# Altium project MCD_Board.PrjPcb (part 1 of 2)
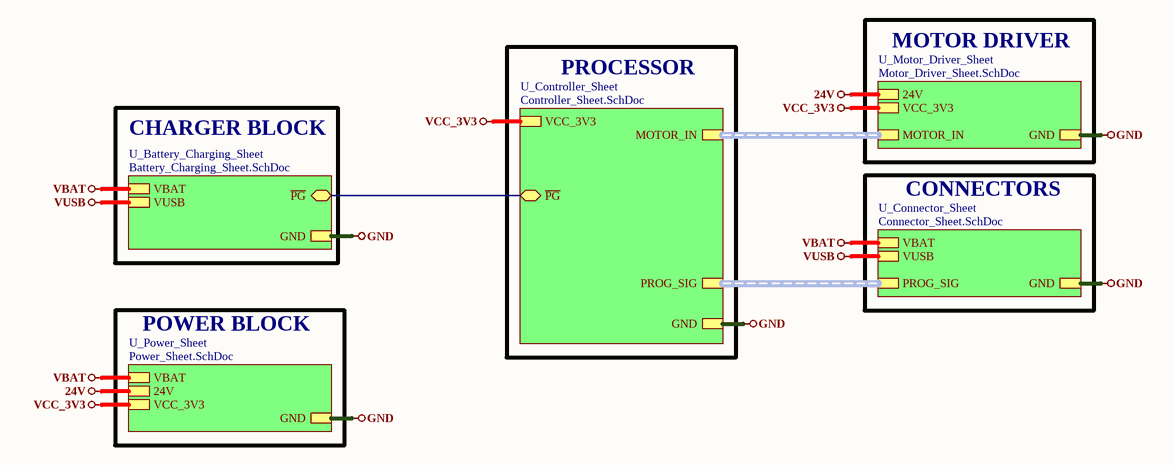
[diagram p0: Top_Sheet.SchDoc]
6 sheets, 91 parts. Net scope: hierarchical (ports join the sheet entries above them; power ports are global).
Board file: MCD_Board.PcbDoc
Sheets:
  Top_Sheet.SchDoc
    U_Battery_Charging_Sheet = Battery_Charging_Sheet.SchDoc
    U_Controller_Sheet = Controller_Sheet.SchDoc
    U_Motor_Driver_Sheet = Motor_Driver_Sheet.SchDoc
    U_Power_Sheet = Power_Sheet.SchDoc
    U_Connector_Sheet = Connector_Sheet.SchDoc

## Sheet Top_Sheet.SchDoc
size A4; DocumentNumber: 1; SheetNumber: 1; SheetTotal: 6

### Sub-sheets
U_Battery_Charging_Sheet = Battery_Charging_Sheet.SchDoc: ~{PG} (bidir), VBAT, GND, VUSB
U_Connector_Sheet = Connector_Sheet.SchDoc: VBAT, GND, VUSB, PROG_SIG (harness PROG_SIG)
U_Controller_Sheet = Controller_Sheet.SchDoc: ~{PG} (bidir), MOTOR_IN (harness MOTOR_IN), GND, VCC_3V3, PROG_SIG (harness PROG_SIG)
U_Motor_Driver_Sheet = Motor_Driver_Sheet.SchDoc: MOTOR_IN (harness MOTOR_IN), GND, 24V, VCC_3V3
U_Power_Sheet = Power_Sheet.SchDoc: VBAT, GND, 24V, VCC_3V3

### Nets
24V: sheet U_Motor_Driver_Sheet/24V, sheet U_Power_Sheet/24V
GND: sheet U_Battery_Charging_Sheet/GND, sheet U_Controller_Sheet/GND, sheet U_Motor_Driver_Sheet/GND, sheet U_Power_Sheet/GND, sheet U_Connector_Sheet/GND
VBAT: sheet U_Battery_Charging_Sheet/VBAT, sheet U_Power_Sheet/VBAT, sheet U_Connector_Sheet/VBAT
VCC_3V3: sheet U_Controller_Sheet/VCC_3V3, sheet U_Motor_Driver_Sheet/VCC_3V3, sheet U_Power_Sheet/VCC_3V3
VUSB: sheet U_Battery_Charging_Sheet/VUSB, sheet U_Connector_Sheet/VUSB
~{PG}: sheet U_Battery_Charging_Sheet/~{PG}, sheet U_Controller_Sheet/~{PG}

### Buses and harness runs
harness sheet U_Connector_Sheet/PROG_SIG = sheet U_Controller_Sheet/PROG_SIG
harness sheet U_Controller_Sheet/MOTOR_IN = sheet U_Motor_Driver_Sheet/MOTOR_IN

### Notes on the sheet
- PROCESSOR
- MOTOR DRIVER
- CHARGER BLOCK
- CONNECTORS
- POWER BLOCK
- 1
- Huzaifa Ali

## Sheet Battery_Charging_Sheet.SchDoc
size A4; DocumentNumber: 3; SheetNumber: 3; SheetTotal: 6
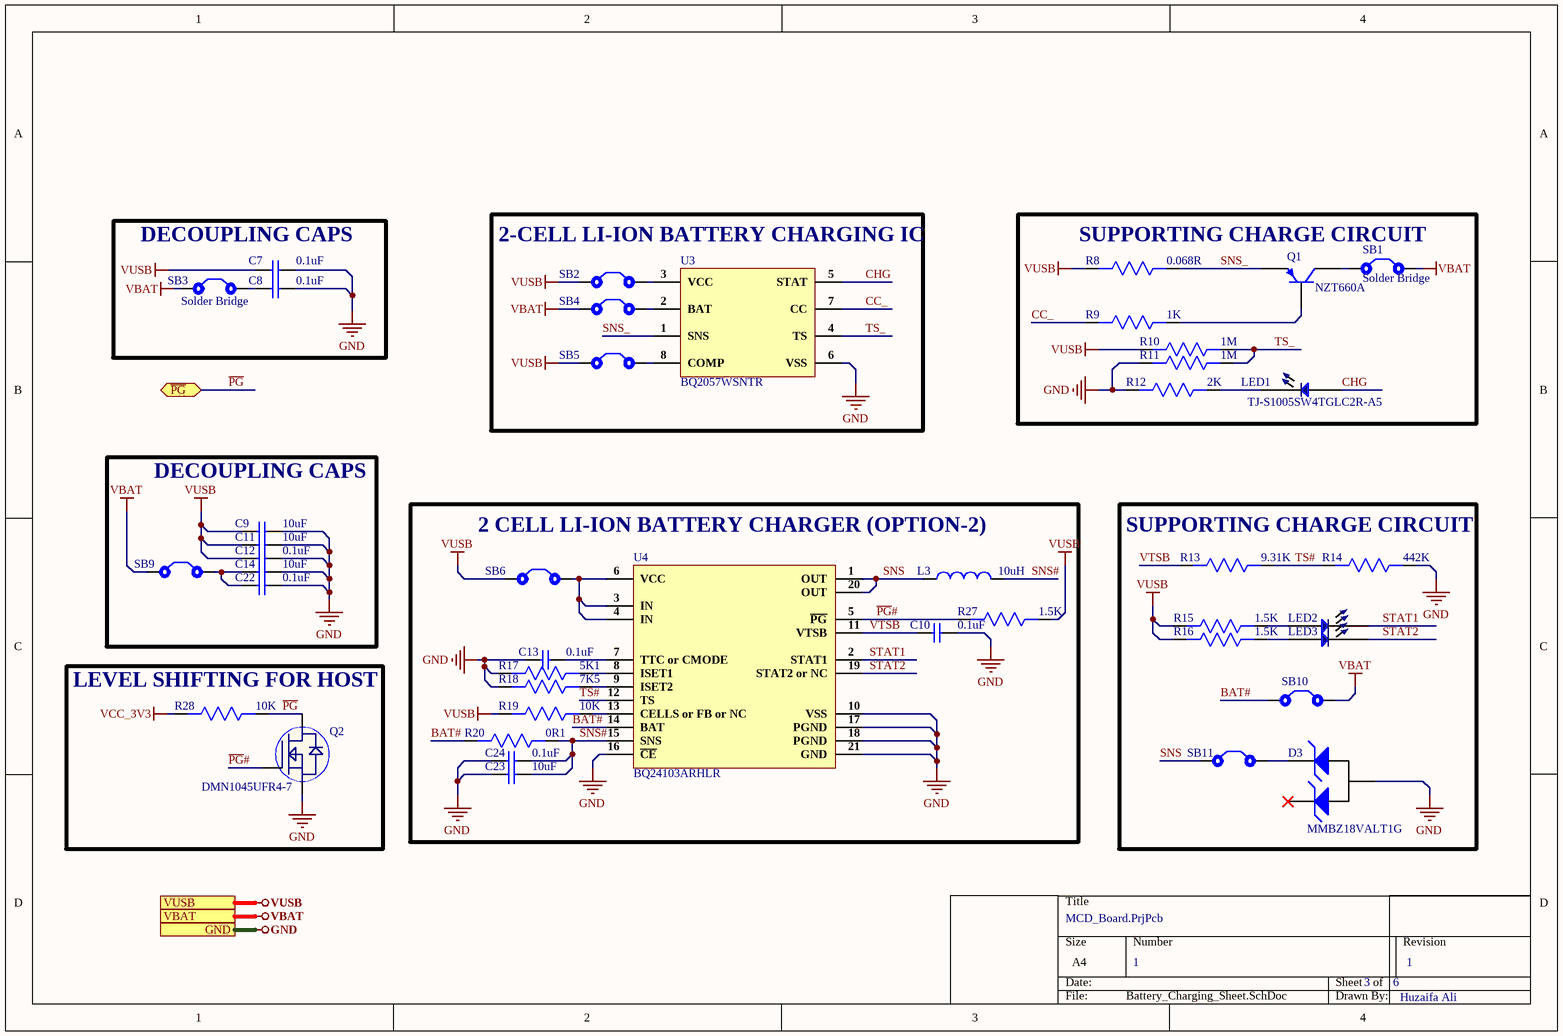
[diagram p1: Battery_Charging_Sheet.SchDoc]

### Parts
C7  0.1uF  [Cap 0402]
C8  0.1uF  [Cap 0402]
C9  10uF  [Cap 0603]
C10  0.1uF  [Cap 0402]
C11  10uF  [Cap 0603]
C12  0.1uF  [Cap 0402]
C13  0.1uF  [Cap 0402]
C14  10uF  [Cap 0603]
C22  0.1uF  [Cap 0402]
C23  10uF  [Cap 0603]
C24  0.1uF  [Cap 0402]
D3  MMBZ18VALT1G  [SOT-23-3]
L3  10uH  [SLF10145T-100M2R5-PF]
LED1  TJ-S1005SW4TGLC2R-A5  [LED 0402]
LED2  TJ-S1005SW4TGLC2R-A5  [LED 0402]  (value not drawn)
LED3  TJ-S1005SW4TGLC2R-A5  [LED 0402]  (value not drawn)
Q1  NZT660A  [NZT660A]
Q2  DMN1045UFR4-7  [DMN1045UFR4-7]
R8  0.068R  [RES 0805]
R9  1K  [Res0402]
R10  1M  [Res0402]
R11  1M  [Res0402]
R12  2K  [Res0402]
R13  9.31K  [Res0603]
R14  442K  [Res0603]
R15  1.5K  [Res-0201]
R16  1.5K  [Res-0201]
R17  5K1  [Res0603]
R18  7K5  [Res0603]
R19  10K  [Res0603]
R20  0R1  [RES 1210]
R27  1.5K  [Res-0201]
R28  10K  [Res0603]
SB1  Solder Bridge  [Solder Bridge]
SB2  Solder Bridge  [Solder Bridge]  (value not drawn)
SB3  Solder Bridge  [Solder Bridge]
SB4  Solder Bridge  [Solder Bridge]  (value not drawn)
SB5  Solder Bridge  [Solder Bridge]  (value not drawn)
SB6  Solder Bridge  [Solder Bridge]  (value not drawn)
SB9  Solder Bridge  [Solder Bridge]  (value not drawn)
SB10  Solder Bridge  [Solder Bridge]  (value not drawn)
SB11  Solder Bridge  [Solder Bridge]  (value not drawn)
U3  BQ2057WSNTR  [BQ2057WSNTR]
U4  BQ24103ARHLR  [BQ24103ARHLR]

### Blocks framed on the sheet
DECOUPLING CAPS: C7 C8 SB3
2-CELL LI-ION BATTERY CHARGING IC: SB2 SB4 SB5 U3
SUPPORTING CHARGE CIRCUIT: LED1 Q1 R8-R12 SB1
DECOUPLING CAPS: C9 C11 C12 C14 C22 SB9
2 CELL LI-ION BATTERY CHARGER (OPTION-2): C10 C13 C23 C24 L3 R17-R20 R27 SB6 U4
SUPPORTING CHARGE CIRCUIT: D3 LED2 LED3 R13-R16 SB10 SB11
LEVEL SHIFTING FOR HOST: Q2 R28

### Ports
GND, VBAT, VUSB, ~{PG} (bidir)

### Nets
GND: C7.2 C8.2 C9.2 C10.2 C11.2 C12.2 C13.1 C14.2 C22.2 C23.1 C24.1 D3.3(A) Q2.2(S) R11.2 R12.2 R14.1 R17.2 R18.2 U3.6(VSS) U4.10(VSS) U4.16(~{CE}) U4.17(PGND) U4.18(PGND) U4.21(GND) ; port GND
VBAT: SB1.2 SB3.1 SB4.1 SB9.1 SB10.2 ; port VBAT
VCC_3V3: R28.2
VUSB: C7.1 C9.1 C11.1 C12.1 R8.2 R10.2 R15.2 R16.2 R19.2 R27.1 SB2.1 SB5.1 SB6.1 ; port VUSB
~{PG}: Q2.3(D) R28.1 ; port ~{PG}
~{PG}#: Q2.1(G) R27.2 U4.5(~{PG})
BAT#: R20.2 SB10.1 U4.14(BAT)
CC_: R9.2 U3.7(CC)
CHG: LED1.1 U3.5(STAT)
SNS: L3.1 SB11.1 U4.1(OUT) U4.20(OUT)
SNS#: C23.2 C24.2 L3.2 R20.1 U4.15(SNS)
SNS_: Q1.3(E) R8.1 U3.1(SNS)
STAT1: LED2.2 U4.2(STAT1)
STAT2: LED3.2 U4.19(STAT2_or_NC)
TS#: R13.1 R14.2 U4.12(TS)
TS_: R10.1 R11.1 U3.4(TS)
VTSB: C10.1 R13.2 U4.11(VTSB)
NetC8_1: C8.1 SB3.2
NetC13_2: C13.2 U4.7(TTC_or_CMODE)
NetC14_1: C14.1 C22.1 SB9.2
NetD3_1: D3.1(K) SB11.2
NetLED1_2: LED1.2 R12.1
NetLED2_1: LED2.1 R15.1
NetLED3_1: LED3.1 R16.1
NetQ1_1: Q1.1(B) R9.1
NetQ1_2: Q1.2(C) SB1.1
NetR17_1: R17.1 U4.8(ISET1)
NetR18_1: R18.1 U4.9(ISET2)
NetR19_1: R19.1 U4.13(CELLS_or_FB_or_NC)
NetSB2_2: SB2.2 U3.3(VCC)
NetSB4_2: SB4.2 U3.2(BAT)
NetSB5_2: SB5.2 U3.8(COMP)
NetSB6_2: SB6.2 U4.3(IN) U4.4(IN) U4.6(VCC)

Not connected (* = marked no-connect by the designer): D3 2(K)*

### Notes on the sheet
- 1
- Huzaifa Ali

### Library data of the parts
C7 C8 C10 C12 C13 C22 C24 = CC0402KRX7R7BB104: CAP CER 0.1UF 16V X7R 0402; Manufacturer: Yageo; Tolerance: 10%; Capacitance: 100nF; Supplier 1: Digi-Key; Manufacturer Part Number: CC0402KRX7R7BB104; Stock 1: 16982736; Pricing 1: 1=0.1, 10=0.034, 100=0.015, 500=0.0107, 1000=0.00841, 2500=0.00764, 5000=0.00703 (USD); Mount: Surface Mount; Case/Package: 0402; Number of Pins: 2; Case Code (Metric): 1005; Case Code (Imperial): 0402; Min Operating Temperature: -55°C; Max Operating Temperature: 125°C; Dielectric: X7R; Voltage Rating: 16V; Voltage Rating (DC): 16V; Packaging: Tape and Reel; Package Quantity: 1; Termination: SMD/SMT; Composition: Ceramic; Voltage: 16V; Length: 1mm; Height: 0.5mm; Width: 0.02inch; Thickness: 0.022inch; Depth: 0.5mm; Radiation Hardening: No; REACH SVHC: No SVHC; Lead Free: Lead Free; Halogen Free: Halogen Free; ComponentLink1URL: http://www.yageo.com/documents/recent/UPY-GPHC_X7R_6.3V-to-50V_8.pdf?src-supplier=Avnet+Europe; ComponentLink1Description: http://www.yageo.com/documents/recent/UPY-GPHC_X7R_6.3V-to-50V_8.pdf?src-supplier=Avnet+Europe; ComponentLink2URL: http://www.yageo.com/documents/recent/UPY-GPHC_X7R_6.3V-to-50V_18.pdf?src-supplier=Digi-Key; ComponentLink2Description: http://www.yageo.com/documents/recent/UPY-GPHC_X7R_6.3V-to-50V_18.pdf?src-supplier=Digi-Key; ComponentLink3URL: http://www.yageo.com/documents/recent/UPY-GPHC_X7R_6.3V-to-50V_8.pdf?src-supplier=Avnet; ComponentLink3Description: http://www.yageo.com/documents/recent/UPY-GPHC_X7R_6.3V-to-50V_8.pdf?src-supplier=Avnet; ComponentLink4URL: http://www.yageo.com/documents/recent/UPY-GPHC_X7R_6.3V-to-50V_18.pdf?src-supplier=Mouser; ComponentLink4Description: http://www.yageo.com/documents/recent/UPY-GPHC_X7R_6.3V-to-50V_18.pdf?src-supplier=Mouser; ComponentLink5URL: http://www.farnell.com/datasheets/2167236.pdf?src-supplier=Element14; ComponentLink5Description: http://www.farnell.com/datasheets/2167236.pdf?src-supplier=Element14; ComponentLink6URL: http://www.farnell.com/datasheets/1489800.pdf?src-supplier=Element14; ComponentLink6Description: http://www.farnell.com/datasheets/1489800.pdf?src-supplier=Element14; Supplier Part Number 1: 311-1338-1-ND
C9 C11 C14 C23 = CL10A106MA8NRNC: CAP CER 10UF 25V X5R 0603; Manufacturer: Samsung; Tolerance: 20%; Supplier 1: Avnet; Manufacturer Part Number: CL10A106MA8NRNC; RoHS: Yes; Category: Ceramic Capacitors; Pricing 1: 4000=0.03753, 8000=0.03700, 16000=0.03595, 24000=0.03515, 32000=0.03383, 40000=0.03304, 400000=0.03225 (USD); Mount: Surface Mount; Case/Package: 0603; Case Code (Metric): 1608; Case Code (Imperial): 0603; Contact Plating: Tin; Min Operating Temperature: -55°C; Max Operating Temperature: 85°C; Package Quantity: 1; Packaging: Tape and Reel; Capacitance: 10uF; Voltage Rating: 25V; Dielectric: X5R; Termination: Wraparound; Series: CL; Construction: Flat; Length: 0.063inch; Width: 0.031inch; Thickness: 0.035inch; Lead Free: Lead Free; RoHS Compliant: Yes; ComponentLink1URL: https://datasheet.ciiva.com/25766/cl10a106ma8nrnc-25766562.pdf?src-supplier=Digi-Key; ComponentLink1Description: https://datasheet.ciiva.com/25766/cl10a106ma8nrnc-25766562.pdf?src-supplier=Digi-Key; Supplier Part Number 1: CL10A106MA8NRNC
D3 = MMBZ18VALT1G: ESD SMD Vr=18V Ippm=1.6A 40W 225mW; Manufacturer: ON Semiconductor; Number of Elements: 2; Reverse Breakdown Voltage: 17.1V; Operating Supply Voltage: 14.5V; Max Surge Current: 1.6A; Direction: Unidirectional; Clamping Voltage: 25V; Power Line Protection: No; Test Current: 1mA; Leakage Current: 50nA; Diode Type: ZENER; Element Configuration: Common Anode; ESD Protection: Yes; Max Breakdown Voltage: 18.9V; Voltage Rating (DC): 18V; Supplier 1: RSComponents; Manufacturer Part Number: MMBZ18VALT1G; RoHS: Yes; Category: Zener Diodes; Stock 1: 100; Pricing 1: 100=0.07400, 300=0.06100, 600=0.05400, 1200=0.04600, 2400=0.04300 (USD); Case/Package: SOT-23-3; Number of Pins: 3; Contact Plating: Tin,Matte; Min Operating Temperature: -55°C; Max Operating Temperature: 150°C; Package Quantity: 1; Packaging: Tape and Reel; Number of Unidirectional Channels: 2; Reverse Standoff Voltage: 14.5V; Min Breakdown Voltage: 17.1V; Peak Pulse Power: 40W; Polarity: Unidirectional; Number of Channels: 2; Breakdown Voltage: 17.1V; Termination: SMD/SMT; Working Voltage: 14.5V; Peak Pulse Current: 1.6A; Resistor Type: Zener; Series: Automotive, AEC-Q101; Max Power Dissipation: 225mW; Max Reverse Leakage Current: 50nA; Power Dissipation: 40W; Clamping Voltage-Max: 25V; Length: 2.9mm; Width: 1.4mm; Height: 1.01mm; Depth: 1.3mm; Radiation Hardening: No; Lead Free: Lead Free; RoHS Compliant: Yes; REACH SVHC: No SVHC; ComponentLink1URL: https://datasheet.ciiva.com/15143/getdatasheetpartid-110231-15143507.pdf?src-supplier=Verical; ComponentLink1Description: https://datasheet.ciiva.com/15143/getdatasheetpartid-110231-15143507.pdf?src-supplier=Verical; ComponentLink2URL: https://datasheet.ciiva.com/4507/mmbz5v6alt1-d-4507882.pdf?src-supplier=Mouser; ComponentLink2Description: https://datasheet.ciiva.com/4507/mmbz5v6alt1-d-4507882.pdf?src-supplier=Mouser; ComponentLink3URL: https://datasheet.ciiva.com/3304/mmbz5v6alt1-d-3304031.pdf?src-supplier=Avnet; ComponentLink3Description: https://datasheet.ciiva.com/3304/mmbz5v6alt1-d-3304031.pdf?src-supplier=Avnet; ComponentLink4URL: https://datasheet.ciiva.com/16379/mmbz5v6alt1-d-16379322.pdf?src-supplier=Future+Electronics; ComponentLink4Description: https://datasheet.ciiva.com/16379/mmbz5v6alt1-d-16379322.pdf?src-supplier=Future+Electronics; ComponentLink5URL: https://datasheet.ciiva.com/339/mmbz5v6alt1-d-339743.pdf?src-supplier=Digi-Key; ComponentLink5Description: https://datasheet.ciiva.com/339/mmbz5v6alt1-d-339743.pdf?src-supplier=Digi-Key; ComponentLink6URL: https://datasheet.ciiva.com/339/mmbz5v6alt1-d-339744.pdf?src-supplier=Digi-Key; ComponentLink6Description: https://datasheet.ciiva.com/339/mmbz5v6alt1-d-339744.pdf?src-supplier=Digi-Key; ComponentLink7URL: https://datasheet.ciiva.com/339/mmbz5v6alt1-d-339742.pdf?src-supplier=Digi-Key; ComponentLink7Description: https://datasheet.ciiva.com/339/mmbz5v6alt1-d-339742.pdf?src-supplier=Digi-Key; Supplier Part Number 1: 7814301
L3 = SLF10145T-100M2R5-PF: FIXED IND 10UH 2.5A 43.7 MOHM; Manufacturer: TDK; Core Material: Ferrite; Tolerance: 20%; Saturation Current: 3A; Shielding: Shielded; DC Resistance (DCR): 36.4mR; Test Frequency: 1kHz; Supplier 1: Digi-Key; Manufacturer Part Number: SLF10145T-100M2R5-PF; Stock 1: 3269; Pricing 1: 1=1.05, 10=0.975, 25=0.9, 50=0.75, 100=0.705, 250=0.63 (USD); Mount: Surface Mount; Case/Package: Nonstandard; Number of Pins: 2; Min Operating Temperature: -40°C; Max Operating Temperature: 105°C; Inductance: 10uH; Max DC Current: 2.5A; Package Quantity: 500; Current Rating: 2.5A; Packaging: Tape and Reel; Inductance Tolerance: 20%; Resistor Type: Wirewound; Termination: SMD/SMT; DC Current: 2.5A; RMS Current (Irms): 3A; Series: SLF; Rated Current-Max: 3A; Length: 10.1mm; Width: 0.398inch; Height: 4.5mm; Height - Seated (Max): 0.189inch; Depth: 10.4mm; Radiation Hardening: No; REACH SVHC: No SVHC; Military Standard: Not; Lead Free: Lead Free; RoHS Compliant: Yes; ComponentLink1URL: http://www.farnell.com/datasheets/1838969.pdf?src-supplier=Element14; ComponentLink1Description: http://www.farnell.com/datasheets/1838969.pdf?src-supplier=Element14; ComponentLink2URL: http://uk.rs-online.com/webdocs/14e9/0900766b814e91a9.pdf?src-supplier=RSComponents; ComponentLink2Description: http://uk.rs-online.com/webdocs/14e9/0900766b814e91a9.pdf?src-supplier=RSComponents; ComponentLink3URL: http://components.arrow.com/part/dataview/42010891S8914805N1165?src-supplier=Arrow+Electronics; ComponentLink3Description: http://components.arrow.com/part/dataview/42010891S8914805N1165?src-supplier=Arrow+Electronics; ComponentLink4URL: http://datasheet.iiic.cc/tdk/SLF10145T-100M2R5-PF.pdf?src-supplier=IIIC; ComponentLink4Description: http://datasheet.iiic.cc/tdk/SLF10145T-100M2R5-PF.pdf?src-supplier=IIIC; Supplier Part Number 1: 445-1975-6-ND
LED1-LED3 = TJ-S1005SW4TGLC2R-A5: Red 625nm 0402 Light Emitting Diodes (LED) RoHS; Manufacturer: TOGIALED; Manufacturer Part No: TJ-S1005SW4TGLC2R-A5; Package: 0402
Q1 = NZT660A: TRANS PNP 60V 3A SOT223; Manufacturer: ON Semiconductor / Fairchild; Max Power Dissipation: 2W; Collector Base Voltage (VCBO): -60V; Emitter Base Voltage (VEBO): -5V; Collector Emitter Saturation Voltage: 500mV; Element Configuration: Single; Gain Bandwidth Product: 75MHz; Number of Elements: 1; Current Rating: -3A; hFE Min: 250; Supplier 1: Digi-Key; Manufacturer Part Number: NZT660A; Stock 1: 9382; Pricing 1: 1=0.48, 10=0.411, 25=0.3832, 100=0.2847, 250=0.27048, 500=0.22228, 1000=0.18068 (USD); Mount: Surface Mount; Case/Package: SOT-223; Number of Pins: 4; Weight: 0.188g; Min Operating Temperature: -55°C; Max Operating Temperature: 150°C; Packaging: Tape and Reel; Package Quantity: 1; Collector Emitter Voltage (VCEO): 60V; Polarity: PNP; Max Collector Current: 3A; Frequency: 75MHz; Collector Emitter Breakdown Voltage: 60V; Transition Frequency: 75MHz; Max Breakdown Voltage: 60V; Power Dissipation: 2W; Voltage Rating (DC): -60V; Radiation Hardening: No; REACH SVHC: No SVHC; Lead Free: Lead Free; ComponentLink1URL: http://www.mouser.com/ds/2/149/NZT660A-191298.pdf?src-supplier=Mouser; ComponentLink1Description: http://www.mouser.com/ds/2/149/NZT660A-191298.pdf?src-supplier=Mouser; ComponentLink2URL: http://www.fairchildsemi.com/datasheets/NZ/NZT660A.pdf?src-supplier=Digi-Key; ComponentLink2Description: http://www.fairchildsemi.com/datasheets/NZ/NZT660A.pdf?src-supplier=Digi-Key; ComponentLink3URL: https://www.fairchildsemi.com/package-drawings/MA/MA04A.pdf?src-supplier=Digi-Key; ComponentLink3Description: https://www.fairchildsemi.com/package-drawings/MA/MA04A.pdf?src-supplier=Digi-Key; ComponentLink4URL: https://www.fairchildsemi.com/datasheets/NZ/NZT660.pdf?src-supplier=Avnet; ComponentLink4Description: https://www.fairchildsemi.com/datasheets/NZ/NZT660.pdf?src-supplier=Avnet; ComponentLink5URL: http://www.fairchildsemi.com/ds/NZ/NZT660.pdf?src-supplier=Avnet; ComponentLink5Description: http://www.fairchildsemi.com/ds/NZ/NZT660.pdf?src-supplier=Avnet; ComponentLink6URL: http://www.farnell.com/datasheets/1794589.pdf?src-supplier=Element14; ComponentLink6Description: http://www.farnell.com/datasheets/1794589.pdf?src-supplier=Element14; ComponentLink7URL: http://www.fairchildsemi.com/ds/NZ/NZT660A.pdf?src-supplier=Future+Electronics; ComponentLink7Description: http://www.fairchildsemi.com/ds/NZ/NZT660A.pdf?src-supplier=Future+Electronics; Supplier Part Number 1: NZT660ACT-ND
Q2 = DMN1045UFR4-7: Mosfet N-ch 12V 3.2A 3-PIN X2-DFN T/r; Manufacturer: Diodes; Rds On Max: 45mR; Input Capacitance: 375pF; Max Power Dissipation: 500mW; Supplier 1: Digi-Key; Manufacturer Part Number: DMN1045UFR4-7; RoHS: Yes; Category: MOSFETs; Pricing 1: 1=0.50000, 10=0.37400, 100=0.23280, 500=0.15930, 1000=0.12254 (USD); Mount: Surface Mount; Number of Pins: 3; Min Operating Temperature: -55°C; Max Operating Temperature: 150°C; Packaging: Tape and Reel; Drain to Source Voltage (Vdss): 12V; Continuous Drain Current (ID): 3.2A; RoHS Compliant: Yes; ComponentLink1URL: http://www.mouser.com/ds/2/115/DMN1045UFR4-526244.pdf?src-supplier=Mouser; ComponentLink1Description: http://www.mouser.com/ds/2/115/DMN1045UFR4-526244.pdf?src-supplier=Mouser; ComponentLink2URL: https://www.diodes.com/assets/Datasheets/DMN1045UFR4.pdf?src-supplier=Digi-Key; ComponentLink2Description: https://www.diodes.com/assets/Datasheets/DMN1045UFR4.pdf?src-supplier=Digi-Key; Supplier Part Number 1: DMN1045UFR4-7DIDKR-ND
R8 = 0805W4F680MT5E: 0.068 ±1% 1/4W ±800ppm/°C 0805 Chip Resistor - Surface Mount RoHS; Manufacturer: UNI-ROYAL(Uniroyal Elec); Manufacturer Part No: 0805W4F680MT5E; Package: 0805; Value: 0.068R
R9 = ERJ-2GEJ102X: RES SMD 1K OHM 5% 1/10W 0402; Manufacturer: Panasonic; Resistance: 1kR; Temperature Coefficient: 200ppm/°C; Voltage Rating: 50V; Power Rating: 100mW; Supplier 1: Digi-Key; Manufacturer Part Number: ERJ-2GEJ102X; Stock 1: 3855795; Pricing 1: 1=0.1, 10=0.032, 100=0.0129, 1000=0.00578, 2500=0.00502, 5000=0.00414 (USD); Mount: Surface Mount; Case/Package: 0402; Contact Plating: Tin; Case Code (Metric): 1005; Case Code (Imperial): 0402; Min Operating Temperature: -55°C; Max Operating Temperature: 155°C; Tolerance: 5%; Composition: Thick Film; Packaging: Tape and Reel; Package Quantity: 1; Number of Terminations: 2; Termination: SMD/SMT; Military Standard: Not; Max Power Dissipation: 100mW; Voltage Rating (DC): 50V; Features: Automotive AEC-Q200; Working Voltage: 50V; Length: 1mm; Height: 0.35mm; Width: 0.02inch; Depth: 0.5mm; Radiation Hardening: No; REACH SVHC: No SVHC; Lead Free: Lead Free; ComponentLink1URL: https://industrial.panasonic.com/cdbs/www-data/pdf/RDA0000/AOA0000C301.pdf?src-supplier=Future+Electronics; ComponentLink1Description: https://industrial.panasonic.com/cdbs/www-data/pdf/RDA0000/AOA0000C301.pdf?src-supplier=Future+Electronics; ComponentLink2URL: http://www.jameco.com/Jameco/Products/ProdDS/1986781.pdf?src-supplier=Jameco; ComponentLink2Description: http://www.jameco.com/Jameco/Products/ProdDS/1986781.pdf?src-supplier=Jameco; ComponentLink3URL: http://www.farnell.com/datasheets/2059623.pdf?src-supplier=Farnell; ComponentLink3Description: http://www.farnell.com/datasheets/2059623.pdf?src-supplier=Farnell; ComponentLink4URL: http://industrial.panasonic.com/www-data/pdf/AOA0000/AOA0000CE1.pdf?src-supplier=Avnet; ComponentLink4Description: http://industrial.panasonic.com/www-data/pdf/AOA0000/AOA0000CE1.pdf?src-supplier=Avnet; ComponentLink5URL: http://www.alliedelec.com/m/d/51cd0790071e1666bdb9d00c57fcf960.pdf?src-supplier=Allied+Electronics; ComponentLink5Description: http://www.alliedelec.com/m/d/51cd0790071e1666bdb9d00c57fcf960.pdf?src-supplier=Allied+Electronics; ComponentLink6URL: http://industrial.panasonic.com/www-data/pdf/AOA0000/AOA0000CE1.pdf?src-supplier=Avnet+Europe; ComponentLink6Description: http://industrial.panasonic.com/www-data/pdf/AOA0000/AOA0000CE1.pdf?src-supplier=Avnet+Europe; ComponentLink7URL: http://www.farnell.com/datasheets/2059623.pdf?src-supplier=Element14; ComponentLink7Description: http://www.farnell.com/datasheets/2059623.pdf?src-supplier=Element14; ComponentLink8URL: http://industrial.panasonic.com/cdbs/www-data/pdf/RDA0000/AOA0000C301.pdf?src-supplier=Farnell; ComponentLink8Description: http://industrial.panasonic.com/cdbs/www-data/pdf/RDA0000/AOA0000C301.pdf?src-supplier=Farnell; ComponentLink9URL: http://industrial.panasonic.com/www-data/pdf/AOA0000/AOA0000CE1.pdf?src-supplier=Avnet+Asia; ComponentLink9Description: http://industrial.panasonic.com/www-data/pdf/AOA0000/AOA0000CE1.pdf?src-supplier=Avnet+Asia; Supplier Part Number 1: P1.0KJCT-ND
R10 R11 = RC0402FR-071ML: RES SMD 1M OHM 1% 1/16W 0402; Manufacturer: Yageo; Resistance: 1MR; Power Rating: 63mW; Voltage Rating: 50V; Temperature Coefficient: 100ppm/°C; Supplier 1: Digi-Key; Manufacturer Part Number: RC0402FR-071ML; Stock 1: 3330803; Pricing 1: 1=0.1, 10=0.016, 100=0.0064, 1000=0.00289, 2500=0.00251, 5000=0.00207 (USD); Case/Package: 0402; Case Code (Imperial): 0402; Case Code (Metric): 1005; Min Operating Temperature: -55°C; Max Operating Temperature: 155°C; Composition: Thick Film; Packaging: Tape and Reel; Tolerance: 1%; Termination: SMD/SMT; Military Standard: Not; Length: 1mm; Height: 0.32mm; Depth: 0.5mm; REACH SVHC: Unknown; Lead Free: Lead Free; ComponentLink1URL: http://www.farnell.com/datasheets/1018594.pdf?src-supplier=Element14; ComponentLink1Description: http://www.farnell.com/datasheets/1018594.pdf?src-supplier=Element14; ComponentLink2URL: http://www.yageo.com/documents/recent/PYu-RC0402_51_RoHS_L_6_r.pdf?src-supplier=Future+Electronics; ComponentLink2Description: http://www.yageo.com/documents/recent/PYu-RC0402_51_RoHS_L_6_r.pdf?src-supplier=Future+Electronics; ComponentLink3URL: http://www.farnell.com/datasheets/2167052.pdf?src-supplier=Element14; ComponentLink3Description: http://www.farnell.com/datasheets/2167052.pdf?src-supplier=Element14; Supplier Part Number 1: 311-1.00MLRCT-ND
R12 = RC0402FR-072KL: RES SMD 2K OHM 1% 1/16W 0402; Manufacturer: Yageo; Resistance: 2kR; Power Rating: 63mW; Voltage Rating: 50V; Temperature Coefficient: 100ppm/°C; Supplier 1: Digi-Key; Manufacturer Part Number: RC0402FR-072KL; Stock 1: 4877389; Pricing 1: 1=0.1, 10=0.016, 100=0.0064, 1000=0.00289, 2500=0.00251, 5000=0.00207 (USD); Case/Package: 0402; Case Code (Metric): 1005; Case Code (Imperial): 0402; Min Operating Temperature: -55°C; Max Operating Temperature: 155°C; Composition: Thick Film; Tolerance: 1%; Package Quantity: 1; Packaging: Tape and Reel; Number of Terminations: 2; Termination: SMD/SMT; Military Standard: Not; Max Power Dissipation: 63mW; Voltage Rating (DC): 50V; Working Voltage: 50V; Features: Moisture Resistant; Length: 1mm; Height: 0.016inch; Width: 0.02inch; Depth: 0.5mm; REACH SVHC: Unknown; Lead Free: Lead Free; ComponentLink1URL: http://www.yageo.com/documents/recent/PYu-RC_Group_51_RoHS_L_10.pdf?src-supplier=Digi-Key; ComponentLink1Description: http://www.yageo.com/documents/recent/PYu-RC_Group_51_RoHS_L_10.pdf?src-supplier=Digi-Key; ComponentLink2URL: http://documents.rs-components.com/techlib://itc_doclist_GB.htm?stockno=6186510&src-supplier=RSComponents; ComponentLink2Description: http://documents.rs-components.com/techlib://itc_doclist_GB.htm?stockno=6186510&src-supplier=RSComponents; ComponentLink3URL: https://www.verical.com/server-webapp/html/getDatasheet?partID=358921&src-supplier=Verical; ComponentLink3Description: https://www.verical.com/server-webapp/html/getDatasheet?partID=358921&src-supplier=Verical; ComponentLink4URL: http://www.mouser.com/ds/2/447/PYu-RC0402_51_RoHS_L_6_r-8721.pdf?src-supplier=Mouser; ComponentLink4Description: http://www.mouser.com/ds/2/447/PYu-RC0402_51_RoHS_L_6_r-8721.pdf?src-supplier=Mouser; ComponentLink5URL: http://www.farnell.com/datasheets/1018594.pdf?src-supplier=Element14; ComponentLink5Description: http://www.farnell.com/datasheets/1018594.pdf?src-supplier=Element14; ComponentLink6URL: http://www.farnell.com/datasheets/2167052.pdf?src-supplier=Element14; ComponentLink6Description: http://www.farnell.com/datasheets/2167052.pdf?src-supplier=Element14; Supplier Part Number 1: 311-2KLRCT-ND
R13 = AC0603DR-079K31L: RES SMD  0603 9.31kOhm 0.5% Paper T/R; Manufacturer: Yageo; Supplier 1: Avnet; Manufacturer Part Number: AC0603DR-079K31L; RoHS: Yes; Category: Resistors; Pricing 1: 5000=0.00314, 10000=0.00309, 20000=0.00300 (USD); RoHS Compliant: Yes; Supplier Part Number 1: AC0603DR-079K31L
R14 = RC0603FR-07442KL: RES SMD 442000Ω ± 1.00% 0.1W ± 100ppm/℃ 0603; Manufacturer: Yageo; Tolerance: 1%; Resistance: 442kR; Power Rating: 100mW; Voltage Rating: 50V; Temperature Coefficient: 100ppm/°C; Supplier 1: Arrow Electronics; Manufacturer Part Number: RC0603FR-07442KL; RoHS: Yes; Category: Chip SMD Resistors; Stock 1: 1267; Pricing 1: 1=0.05220, 10=0.01890, 25=0.01870, 100=0.00820, 250=0.00770, 500=0.00760, 1000=0.00390 (USD); Case/Package: 0603; Case Code (Metric): 1608; Case Code (Imperial): 0603; Size Code: 0603; Min Operating Temperature: -55°C; Max Operating Temperature: 155°C; Package Quantity: 1; Packaging: Tape and Reel; Resistor Type: Thick Film; Number of Terminations: 2; Termination: SMD/SMT; Max Power Dissipation: 100mW; Voltage Rating (DC): 50V; Features: Moisture Resistant; Series: RC; Construction: Rectangular; Length: 1.6mm; Width: 0.031inch; Height: 0.022inch; Depth: 0.8mm; Military Standard: Not; Lead Free: Lead Free; RoHS Compliant: Yes; ComponentLink1URL: https://datasheet.ciiva.com/2455/pyu-r-int-thick-7-2455156.pdf?src-supplier=Digi-Key; ComponentLink1Description: https://datasheet.ciiva.com/2455/pyu-r-int-thick-7-2455156.pdf?src-supplier=Digi-Key; ComponentLink2URL: https://datasheet.ciiva.com/2455/pyu-r-int-thick-7-2455157.pdf?src-supplier=Digi-Key; ComponentLink2Description: https://datasheet.ciiva.com/2455/pyu-r-int-thick-7-2455157.pdf?src-supplier=Digi-Key; ComponentLink3URL: https://datasheet.ciiva.com/2455/pyu-r-int-thick-7-2455155.pdf?src-supplier=Digi-Key; ComponentLink3Description: https://datasheet.ciiva.com/2455/pyu-r-int-thick-7-2455155.pdf?src-supplier=Digi-Key; ComponentLink4URL: https://datasheet.ciiva.com/12558/rc0603-272842-12558427.pdf?src-supplier=Mouser; ComponentLink4Description: https://datasheet.ciiva.com/12558/rc0603-272842-12558427.pdf?src-supplier=Mouser; Supplier Part Number 1: RC0603FR-07442KL
R15 R16 R27 = RMCF0201FT1K50: RES SMD 1.5K OHM 1% 1/20W 0201; Manufacturer: Stackpole Electronics; Resistance: 1.5kR; Max Power Dissipation: 50mW; Temperature Coefficient: 200ppm/°C; Supplier 1: Digi-Key; Manufacturer Part Number: RMCF0201FT1K50; RoHS: Yes; Category: Chip SMD Resistors; Stock 1: 151457; Pricing 1: 1=0.10000, 10=0.02700, 100=0.01090, 1000=0.00488, 2500=0.00423, 5000=0.00350 (USD); Mount: Surface Mount; Case/Package: 0201; Case Code (Metric): 0603; Case Code (Imperial): 0201; Contact Plating: Tin,Matte; Min Operating Temperature: -55°C; Max Operating Temperature: 125°C; Packaging: Tape and Reel; Tolerance: 1%; Resistor Type: Thick Film; Number of Terminations: 2; Series: RMCF; Length: 0.024inch; Width: 0.012inch; Height: 0.009inch; Radiation Hardening: No; RoHS Compliant: Yes; ComponentLink1URL: https://www.seielect.com/Catalog/SEI-RMCF_RMCP.pdf?src-supplier=Digi-Key; ComponentLink1Description: https://www.seielect.com/Catalog/SEI-RMCF_RMCP.pdf?src-supplier=Digi-Key; ComponentLink2URL: https://www.seielect.com/catalog/SEI-Packaging.pdf?src-supplier=Digi-Key; ComponentLink2Description: https://www.seielect.com/catalog/SEI-Packaging.pdf?src-supplier=Digi-Key; ComponentLink3URL: https://www.seielect.com/catalog/SEI-RMCF_RMCP.pdf?src-supplier=Avnet; ComponentLink3Description: https://www.seielect.com/catalog/SEI-RMCF_RMCP.pdf?src-supplier=Avnet; Supplier Part Number 1: RMCF0201FT1K50CT-ND
R17 = AC0603FR-075K1L: Res Thick Film 0603 5.1K Ohm 1% 1/10W ±100ppm/°C Molded SMD Paper T/R; Manufacturer: Yageo; Resistance: 5.1kR; Power Rating: 100mW; Voltage Rating: 50V; Supplier 1: RSComponents; Manufacturer Part Number: AC0603FR-075K1L; RoHS: Yes; Category: Chip SMD Resistors; Stock 1: 8000; Pricing 1: 500=0.00700, 2500=0.00700, 5000=0.00600, 7500=0.00600, 10000=0.00500 (GBP); Case/Package: 0603; Case Code (Imperial): 0603; Case Code (Metric): 1608; Weight: 7.1E-05oz; Min Operating Temperature: -55°C; Max Operating Temperature: 155°C; Tolerance: 1%; Packaging: Tape and Reel; Resistor Type: Thick Film; Number of Terminations: 2; Termination: SMD/SMT; Max Power Dissipation: 100mW; Temperature Coefficient: 100ppm/°C; Features: Moisture Resistant,Automotive AEC-Q200; Series: AC; Length: 0.063inch; Width: 0.031inch; Height: 0.022inch; RoHS Compliant: Yes; ComponentLink1URL: https://datasheet.ciiva.com/12577/pyu-ac-51-rohs-l-2-12577183.pdf?src-supplier=Mouser; ComponentLink1Description: https://datasheet.ciiva.com/12577/pyu-ac-51-rohs-l-2-12577183.pdf?src-supplier=Mouser; Supplier Part Number 1: 1978087
R18 = RC0603FR-077K5L: RES 7.5K OHM 1% 1/10W 0603; Manufacturer: Yageo; Resistance: 7.5kR; Power Rating: 100mW; Voltage Rating: 50V; Temperature Coefficient: 100ppm/°C; Working Voltage: 75V; Supplier 1: Newark; Manufacturer Part Number: RC0603FR-077K5L; RoHS: Yes; Category: Chip SMD Resistors; Stock 1: 2689; Pricing 1: 1=0.10000, 25=0.01800, 50=0.01300, 100=0.00700 (USD); Case/Package: 0603; Number of Pins: 2; Case Code (Metric): 1608; Case Code (Imperial): 0603; Min Operating Temperature: -55°C; Max Operating Temperature: 155°C; Package Quantity: 1; Tolerance: 1%; Packaging: Tape and Reel; Resistor Type: Thick Film; Number of Terminations: 2; Termination: SMD/SMT; Max Power Dissipation: 100mW; Voltage Rating (DC): 50V; Features: Moisture Resistant; Series: RC; Technology: THICK FILM; Construction: Rectangular; Resistance Tolerance: 1%; Length: 1.6mm; Width: 0.031inch; Height: 0.45mm; Depth: 0.8mm; RoHS Compliant: Yes; REACH SVHC: No SVHC; Military Standard: Not; Lead Free: Lead Free; ComponentLink1URL: https://datasheet.ciiva.com/11808/0900766b80f96399-11808401.pdf?src-supplier=RSComponents; ComponentLink1Description: https://datasheet.ciiva.com/11808/0900766b80f96399-11808401.pdf?src-supplier=RSComponents; ComponentLink2URL: https://datasheet.ciiva.com/46395/443971-46395019.pdf?src-supplier=Element14; ComponentLink2Description: https://datasheet.ciiva.com/46395/443971-46395019.pdf?src-supplier=Element14; ComponentLink3URL: https://datasheet.ciiva.com/2519/pyu-r-int-thick-7-2519121.pdf?src-supplier=Digi-Key; ComponentLink3Description: https://datasheet.ciiva.com/2519/pyu-r-int-thick-7-2519121.pdf?src-supplier=Digi-Key; ComponentLink4URL: https://datasheet.ciiva.com/2519/pyu-r-int-thick-7-2519122.pdf?src-supplier=Digi-Key; ComponentLink4Description: https://datasheet.ciiva.com/2519/pyu-r-int-thick-7-2519122.pdf?src-supplier=Digi-Key; ComponentLink5URL: https://datasheet.ciiva.com/2519/pyu-r-int-thick-7-2519120.pdf?src-supplier=Digi-Key; ComponentLink5Description: https://datasheet.ciiva.com/2519/pyu-r-int-thick-7-2519120.pdf?src-supplier=Digi-Key; ComponentLink6URL: https://datasheet.ciiva.com/12555/rc0603-272842-12555256.pdf?src-supplier=Mouser; ComponentLink6Description: https://datasheet.ciiva.com/12555/rc0603-272842-12555256.pdf?src-supplier=Mouser; ComponentLink7URL: https://datasheet.ciiva.com/15189/getdatasheetpartid-326523-15189821.pdf?src-supplier=Verical; ComponentLink7Description: https://datasheet.ciiva.com/15189/getdatasheetpartid-326523-15189821.pdf?src-supplier=Verical; Supplier Part Number 1: 68R0113
R19 R28 = AC0603JR-0710KL: RES SMD 10K OHM 5% 1/10W 0603; Manufacturer: Yageo; Voltage Rating: 50V; Resistance: 10kR; Power Rating: 100mW; Temperature Coefficient: 100ppm/°C; Supplier 1: Future Electronics; Manufacturer Part Number: AC0603JR-0710KL; RoHS: Yes; Category: Chip SMD Resistors; Stock 1: 1533000; Pricing 1: 5000=0.00540 (USD); Case/Package: 0603; Case Code (Imperial): 0603; Case Code (Metric): 1608; Size Code: 0603; Min Operating Temperature: -55°C; Max Operating Temperature: 155°C; Packaging: Tape and Reel; Tolerance: 5%; Package Quantity: 1; Resistor Type: Thick Film; Termination: SMD/SMT; Number of Terminations: 2; Max Power Dissipation: 100mW; Features: Moisture Resistant,Automotive AEC-Q200,Anti-Sulfur; Series: AC; Construction: Rectangular; Length: 0.063inch; Width: 0.031inch; Height: 0.022inch; Depth: 0.8mm; Military Standard: Not; Lead Free: Lead Free; RoHS Compliant: Yes; ComponentLink1URL: https://datasheet.ciiva.com/5562/pyu-ac-51-rohs-l-2-5562553.pdf?src-supplier=Mouser; ComponentLink1Description: https://datasheet.ciiva.com/5562/pyu-ac-51-rohs-l-2-5562553.pdf?src-supplier=Mouser; Supplier Part Number 1: 1029044
R20 = CRH1210FR100P05Z: RES SMD 660mW 0.1Ω 1210; Manufacturer: Ever Ohms Tech; Tolerance: ±1%; Package: 1210; Power(Watts): 660mW; Type: Thick Film Resistors; Operating Temperature Range: -55℃~+155℃
SB1-SB6 SB9-SB11 = Solder Bridge: Solder Bridge ON
U3 = BQ2057WSNTR: IC LI-ION LDO CHARGE MGMT 8SOIC; Manufacturer: Texas Instruments; Output Current: 2A; Output Voltage: 8.4V; Min Supply Voltage: 4.5V; Max Supply Voltage: 15V; Number of Cells: 2; Supplier 1: Digi-Key; Manufacturer Part Number: BQ2057WSNTR; Stock 1: 9023; Pricing 1: 1=2.01, 10=1.802, 25=1.7, 100=1.36, 250=1.19, 500=1.156, 1000=0.918 (USD); Case/Package: D; Number of Pins: 8; Weight: 0.002677oz; Contact Plating: Gold; Min Operating Temperature: -20°C; Max Operating Temperature: 70°C; Packaging: Tape and Reel; Package Quantity: 2500; Min Input Voltage: 4.5V; Battery Pack Voltage: 8.4V; Radiation Hardening: No; Lead Free: Lead Free; ComponentLink1URL: http://www.ti.com/lit/ds/symlink/bq2057c.pdf?src-supplier=Digi-Key; ComponentLink1Description: http://www.ti.com/lit/ds/symlink/bq2057c.pdf?src-supplier=Digi-Key; ComponentLink2URL: http://focus.ti.com/lit/ds/symlink/bq2057.pdf?src-supplier=Avnet+Europe; ComponentLink2Description: http://focus.ti.com/lit/ds/symlink/bq2057.pdf?src-supplier=Avnet+Europe; ComponentLink3URL: http://www.ti.com/general/docs/lit/getliterature.tsp?genericPartNumber=BQ2057W&&fileType=pdf&src-supplier=Avnet; ComponentLink3Description: http://www.ti.com/general/docs/lit/getliterature.tsp?genericPartNumber=BQ2057W&&fileType=pdf&src-supplier=Avnet; ComponentLink4URL: https://www.verical.com/server-webapp/html/getDatasheet?partID=613088&src-supplier=Verical; ComponentLink4Description: https://www.verical.com/server-webapp/html/getDatasheet?partID=613088&src-supplier=Verical; ComponentLink5URL: http://datasheet.iiic.cc/texas_instruments/BQ2057WSNTR.pdf?src-supplier=IIIC; ComponentLink5Description: http://datasheet.iiic.cc/texas_instruments/BQ2057WSNTR.pdf?src-supplier=IIIC; Supplier Part Number 1: 296-41202-1-ND
U4 = BQ24103ARHLR: IC BATT CHARGER LI-ION 20QFN; Manufacturer: Texas Instruments; Output Current: 2A; Max Supply Voltage: 16V; Min Supply Voltage: 4.35V; Number of Cells: 12; Output Voltage: 4.2V; Min Input Voltage: 4.3V; Switching Frequency: 1.1MHz; Supplier 1: Mouser; Manufacturer Part Number: BQ24103ARHLR; RoHS: Yes; Category: Battery Management; Pricing 1: 1=5.70000, 10=5.13000, 25=4.85000, 50=4.85000, 100=4.20000, 250=3.99000, 500=3.58000, 1000=3.13000, 3000=3.12000, 10000=3.12000 (USD); Case/Package: QFN; Number of Pins: 20; Weight: 0.001668oz; Contact Plating: Gold; Min Operating Temperature: -40°C; Max Operating Temperature: 85°C; Packaging: Tape and Reel; Package Quantity: 1; Series: bqSWITCHER™; Max Charge Current: 2A; Radiation Hardening: No; Lead Free: Lead Free; RoHS Compliant: Yes; REACH SVHC: No SVHC; ComponentLink1URL: https://datasheet.ciiva.com/15114/getdatasheetpartid-165603-15114467.pdf?src-supplier=Verical; ComponentLink1Description: https://datasheet.ciiva.com/15114/getdatasheetpartid-165603-15114467.pdf?src-supplier=Verical; ComponentLink2URL: https://datasheet.ciiva.com/1136/1831046-1136638.pdf?src-supplier=Element14; ComponentLink2Description: https://datasheet.ciiva.com/1136/1831046-1136638.pdf?src-supplier=Element14; ComponentLink3URL: https://datasheet.ciiva.com/1136/1831046-1136637.pdf?src-supplier=Element14; ComponentLink3Description: https://datasheet.ciiva.com/1136/1831046-1136637.pdf?src-supplier=Element14; ComponentLink4URL: https://datasheet.ciiva.com/46404/1785919-46404762.pdf?src-supplier=Element14; ComponentLink4Description: https://datasheet.ciiva.com/46404/1785919-46404762.pdf?src-supplier=Element14; ComponentLink5URL: https://datasheet.ciiva.com/1932/bq24100-1932398.pdf?src-supplier=Digi-Key; ComponentLink5Description: https://datasheet.ciiva.com/1932/bq24100-1932398.pdf?src-supplier=Digi-Key; ComponentLink6URL: https://datasheet.ciiva.com/1932/bq24100-1932397.pdf?src-supplier=Digi-Key; ComponentLink6Description: https://datasheet.ciiva.com/1932/bq24100-1932397.pdf?src-supplier=Digi-Key; ComponentLink7URL: https://datasheet.ciiva.com/1932/bq24100-1932399.pdf?src-supplier=Digi-Key; ComponentLink7Description: https://datasheet.ciiva.com/1932/bq24100-1932399.pdf?src-supplier=Digi-Key; ComponentLink8URL: https://datasheet.ciiva.com/4873/slus606o-82020-4873407.pdf?src-supplier=Mouser; ComponentLink8Description: https://datasheet.ciiva.com/4873/slus606o-82020-4873407.pdf?src-supplier=Mouser; Supplier Part Number 1: 595-BQ24103ARHLR

## Sheet Controller_Sheet.SchDoc
size A4; SheetNumber: 4; SheetTotal: 6
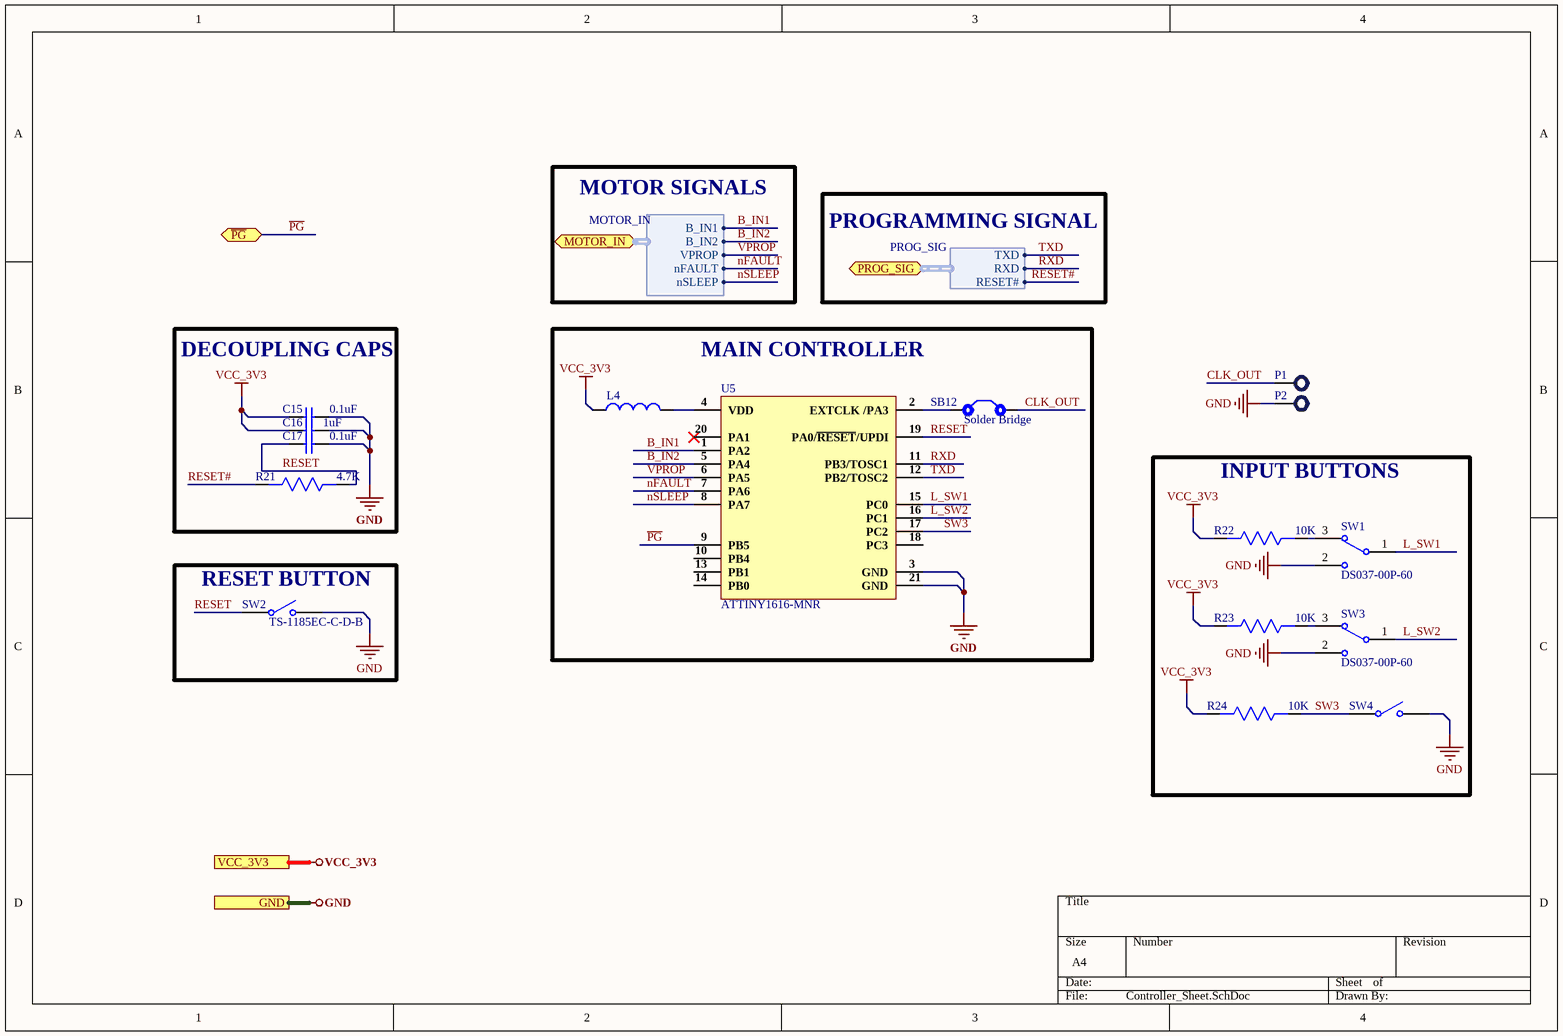
[diagram p2: Controller_Sheet.SchDoc]

### Parts
C15  0.1uF  [Cap 0402]
C16  1uF  [Cap 0402]
C17  0.1uF  [Cap 0402]
L4  MMZ0603S601CT000  [IND 0201]  (value not drawn)
P1  TEST POINT  [TEST POINT]  (value not drawn)
P2  TEST POINT  [TEST POINT]  (value not drawn)
R21  4.7K  [Res0402]
R22  10K  [Res0402]
R23  10K  [Res0402]
R24  10K  [Res0402]
SB12  Solder Bridge  [Solder Bridge]
SW1  DS037-00P-60  [DS037-00P-60]
SW2  TS-1185EC-C-D-B  [TS-1185EC-C-D-B]
SW3  DS037-00P-60  [DS037-00P-60]
SW4  TS-1185EC-C-D-B  [TS-1185EC-C-D-B]  (value not drawn)
U5  ATTINY1616-MNR  [20-QFN]

### Blocks framed on the sheet
DECOUPLING CAPS: C15-C17 R21
MAIN CONTROLLER: L4 SB12 U5
INPUT BUTTONS: R22-R24 SW1 SW3 SW4
RESET BUTTON: SW2

### Ports
GND, MOTOR_IN (bidir, harness MOTOR_IN), PROG_SIG (bidir, harness PROG_SIG), VCC_3V3, ~{PG} (bidir)

### Harnesses
MOTOR_IN: B_IN1, B_IN2, VPROP, nFAULT, nSLEEP
PROG_SIG: TXD, RXD, RESET#

### Nets
GND: C15.2 C16.2 C17.2 P2.1 SW1.2 SW2.2 SW3.2 SW4.2 U5.3(GND) U5.21(GND) ; port GND
VCC_3V3: C15.1 C16.1 L4.1 R22.2 R23.2 R24.2 ; port VCC_3V3
~{PG}: U5.9(PB5) ; port ~{PG}
B_IN1: U5.1(PA2) ; port MOTOR_IN.B_IN1
B_IN2: U5.5(PA4) ; port MOTOR_IN.B_IN2
CLK_OUT: P1.1 SB12.2
L_SW1: SW1.1 U5.15(PC0)
L_SW2: SW3.1 U5.16(PC1)
nFAULT: U5.7(PA6) ; port MOTOR_IN.nFAULT
nSLEEP: U5.8(PA7) ; port MOTOR_IN.nSLEEP
RESET: C17.1 R21.1 SW2.1 U5.19(PA0/~{RESET}/UPDI)
RESET#: R21.2 ; port PROG_SIG.RESET#
RXD: U5.11(PB3/TOSC1) ; port PROG_SIG.RXD
SW3: R24.1 SW4.1 U5.17(PC2)
TXD: U5.12(PB2/TOSC2) ; port PROG_SIG.TXD
VPROP: U5.6(PA5) ; port MOTOR_IN.VPROP
NetL4_2: L4.2 U5.4(VDD)
NetR22_1: R22.1 SW1.3
NetR23_1: R23.1 SW3.3
NetSB12_1: SB12.1 U5.2(EXTCLK_/PA3)

Not connected (* = marked no-connect by the designer): U5 10(PB4) 13(PB1) 14(PB0) 18(PC3) 20(PA1)*

### Notes on the sheet
- MOTOR SIGNALS
- PROGRAMMING SIGNAL

### Library data of the parts
C15 C17 = CC0402KRX7R7BB104: as C7 on sheet Battery_Charging_Sheet; Supplier 1: Digi-Key; Manufacturer Part Number: CC0402KRX7R7BB104; Stock 1: 16982736; Pricing 1: 1=0.1, 10=0.034, 100=0.015, 500=0.0107, 1000=0.00841, 2500=0.00764, 5000=0.00703 (USD); Mount: Surface Mount; Case/Package: 0402; Number of Pins: 2; Case Code (Metric): 1005; Case Code (Imperial): 0402; Min Operating Temperature: -55°C; Max Operating Temperature: 125°C; Dielectric: X7R; Voltage Rating: 16V; Voltage Rating (DC): 16V; Packaging: Tape and Reel; Package Quantity: 1; Termination: SMD/SMT; Composition: Ceramic; Voltage: 16V; Length: 1mm; Height: 0.5mm; Width: 0.02inch; Thickness: 0.022inch; Depth: 0.5mm; Radiation Hardening: No; REACH SVHC: No SVHC; Lead Free: Lead Free; Halogen Free: Halogen Free; ComponentLink1URL: http://www.yageo.com/documents/recent/UPY-GPHC_X7R_6.3V-to-50V_8.pdf?src-supplier=Avnet+Europe; ComponentLink1Description: http://www.yageo.com/documents/recent/UPY-GPHC_X7R_6.3V-to-50V_8.pdf?src-supplier=Avnet+Europe; ComponentLink2URL: http://www.yageo.com/documents/recent/UPY-GPHC_X7R_6.3V-to-50V_18.pdf?src-supplier=Digi-Key; ComponentLink2Description: http://www.yageo.com/documents/recent/UPY-GPHC_X7R_6.3V-to-50V_18.pdf?src-supplier=Digi-Key; ComponentLink3URL: http://www.yageo.com/documents/recent/UPY-GPHC_X7R_6.3V-to-50V_8.pdf?src-supplier=Avnet; ComponentLink3Description: http://www.yageo.com/documents/recent/UPY-GPHC_X7R_6.3V-to-50V_8.pdf?src-supplier=Avnet; ComponentLink4URL: http://www.yageo.com/documents/recent/UPY-GPHC_X7R_6.3V-to-50V_18.pdf?src-supplier=Mouser; ComponentLink4Description: http://www.yageo.com/documents/recent/UPY-GPHC_X7R_6.3V-to-50V_18.pdf?src-supplier=Mouser; ComponentLink5URL: http://www.farnell.com/datasheets/2167236.pdf?src-supplier=Element14; ComponentLink5Description: http://www.farnell.com/datasheets/2167236.pdf?src-supplier=Element14; ComponentLink6URL: http://www.farnell.com/datasheets/1489800.pdf?src-supplier=Element14; ComponentLink6Description: http://www.farnell.com/datasheets/1489800.pdf?src-supplier=Element14; Supplier Part Number 1: 311-1338-1-ND
C16 = GRM155R61E105KA12D: CAP CER 1UF 25V X5R 0402; Manufacturer: Murata; Material: Ceramic; Tolerance: 10%; Supplier 1: Digi-Key; Manufacturer Part Number: GRM155R61E105KA12D; Stock 1: 1194305; Pricing 1: 1=0.11, 10=0.077, 100=0.0363, 500=0.02546, 1000=0.02108, 2500=0.01962, 5000=0.01795 (USD); Mount: Surface Mount; Case/Package: 0402; Weight: 0.000212oz; Case Code (Metric): 1005; Case Code (Imperial): 0402; Min Operating Temperature: -55°C; Max Operating Temperature: 85°C; Capacitance: 1uF; Voltage Rating: 25V; Packaging: Tape and Reel; Dielectric: X5R; Voltage: 25V; Termination: SMD/SMT; Voltage Rating (DC): 25V; Package Quantity: 10000; Length: 1mm; Height: 0.5mm; Width: 0.5mm; Thickness: 0.022inch; Depth: 0.5mm; REACH SVHC: No SVHC; Lead Free: Lead Free; ComponentLink1URL: http://www.farnell.com/datasheets/2048341.pdf?src-supplier=Element14; ComponentLink1Description: http://www.farnell.com/datasheets/2048341.pdf?src-supplier=Element14; Supplier Part Number 1: 490-10017-1-ND
L4 = MMZ0603S601CT000: FERRITE BEAD 600 OHM 0201 1LN; Manufacturer: TDK; Impedance: 600R; Tolerance: 25%; DC Resistance (DCR): 1.45R; Max DC Current: 100mA; Supplier 1: Digi-Key; Manufacturer Part Number: MMZ0603S601CT000; RoHS: Yes; Category: Inductors; Stock 1: 1540; Pricing 1: 1=0.12000, 10=0.09900, 25=0.07680, 50=0.06380, 100=0.05500, 250=0.04400, 500=0.03960, 1000=0.03300, 5000=0.03080 (USD); Mount: Surface Mount; Case/Package: 0201; Core Material: Ferrite; Case Code (Metric): 0603; Case Code (Imperial): 0201; Packaging: Cut Tape; Package Quantity: 15000; Current Rating: 100mA; Length: 0.024inch; Width: 0.012inch; Height: 0.013inch; REACH SVHC: No SVHC; Lead Free: Lead Free; RoHS Compliant: Yes; ComponentLink1URL: https://datasheet.ciiva.com/46381/1795294-46381669.pdf?src-supplier=Element14; ComponentLink1Description: https://datasheet.ciiva.com/46381/1795294-46381669.pdf?src-supplier=Element14; ComponentLink2URL: https://datasheet.ciiva.com/46634/beads-commercial-signal-mmz-en-46634390.pdf?src-supplier=Digi-Key; ComponentLink2Description: https://datasheet.ciiva.com/46634/beads-commercial-signal-mmz-en-46634390.pdf?src-supplier=Digi-Key; ComponentLink3URL: https://datasheet.ciiva.com/48682/beads-commercial-signal-mmz-en-48682603.pdf?src-supplier=Avnet; ComponentLink3Description: https://datasheet.ciiva.com/48682/beads-commercial-signal-mmz-en-48682603.pdf?src-supplier=Avnet; ComponentLink4URL: https://datasheet.ciiva.com/46634/beads-commercial-signal-mmz-en-46634381.pdf?src-supplier=Digi-Key; ComponentLink4Description: https://datasheet.ciiva.com/46634/beads-commercial-signal-mmz-en-46634381.pdf?src-supplier=Digi-Key; Supplier Part Number 1: 445-2146-1-ND
P1 P2 = TEST POINT: Test Point ON
R21 = CR0402JF0472G: 4.7K ±5% 1/16W ±200ppm/°C 0402 Chip Resistor - Surface Mount RoHS; Manufacturer: LIZ Elec; Manufacturer Part No: CR0402JF0472G; Package: 0402; Value: 4.7K
R22-R24 = RK73B1ETTP103J: RES 10K OHM 5% 1/10W 0402; Manufacturer: KOA Speer; Resistance: 10kR; Power Rating: 63mW; Voltage Rating: 50V; Temperature Coefficient: 200ppm/°C; Supplier 1: Digi-Key; Manufacturer Part Number: RK73B1ETTP103J; Stock 1: 2917894; Pricing 1: 1=0.1, 10=0.016, 100=0.0065, 1000=0.00292, 2500=0.00253, 5000=0.00209 (USD); Mount: Surface Mount; Case/Package: 0402; Case Code (Imperial): 0402; Case Code (Metric): 1005; Min Operating Temperature: -55°C; Max Operating Temperature: 155°C; Packaging: Tape and Reel; Tolerance: 5%; Package Quantity: 10000; Composition: Thick Film; Termination: SMD/SMT; Military Standard: Not; Voltage Rating (DC): 50V; Length: 1mm; Height: 0.35mm; Width: 0.5mm; Depth: 0.5mm; Lead Free: Lead Free; ComponentLink1URL: https://www.verical.com/server-webapp/html/getDatasheet?partID=89073&src-supplier=Verical; ComponentLink1Description: https://www.verical.com/server-webapp/html/getDatasheet?partID=89073&src-supplier=Verical; Supplier Part Number 1: 2019-RK73B1ETTP103JCT-ND
SB12 = Solder Bridge: Solder Bridge ON
SW1 SW3 = DS037-00P-60: 8.2mm 300mA 2.7mm 6V SPDT Micro Switch -25℃~+85℃ PCPin 9.9mm 100000 Plugin Microswitches ROHS; Manufacturer: XKB Connectivity; Manufacturer Part num:: DS037-00P-60; Footprint: Custom
SW2 SW4 = TS-1185EC-C-D-B: 3mm 2mm Round Button 50mA Top3.65mm SPST 12V SMD Tactile Switches; Manufacturer: XKB; Manufacturer Part No: TS-1185EC-C-D-B; Package: Custom; ComponentLink1Description: LCSC; ComponentLink1URL: https://lcsc.com/product-detail/Tactile-Switches_XKB-Connectivity-TS-1185EC-C-D-B_C318893.html
U5 = ATTINY1616-MNR: IC MCU 8BIT 16KB FLASH 20VQFN; Manufacturer: Microchip; Interface: I2C,SPI,IrDA,UART,USART; Peripherals: Brown-out Detect/Reset,POR,PWM,WDT; Core Architecture: AVR; Frequency: 20MHz; Number of I/Os: 18; Oscillator Type: Internal; Supplier 1: Digi-Key; Manufacturer Part Number: ATTINY1616-MNR; RoHS: No; Category: Microcontrollers; Stock 1: 3963; Pricing 1: 1=0.75000, 25=0.69000, 100=0.62000 (USD); Case/Package: VQFN; Min Operating Temperature: -40°C; Max Operating Temperature: 105°C; Memory Type: FLASH; Packaging: Cut Tape; Memory Size: 16KB; ComponentLink1URL: http://www.microchip.com/mymicrochip/filehandler.aspx?ddocname=en606269&src-supplier=Digi-Key; ComponentLink1Description: http://www.microchip.com/mymicrochip/filehandler.aspx?ddocname=en606269&src-supplier=Digi-Key; Supplier Part Number 1: ATTINY1616-MNRCT-ND